# Altium project COMPSYS301_Group2.PrjPcb
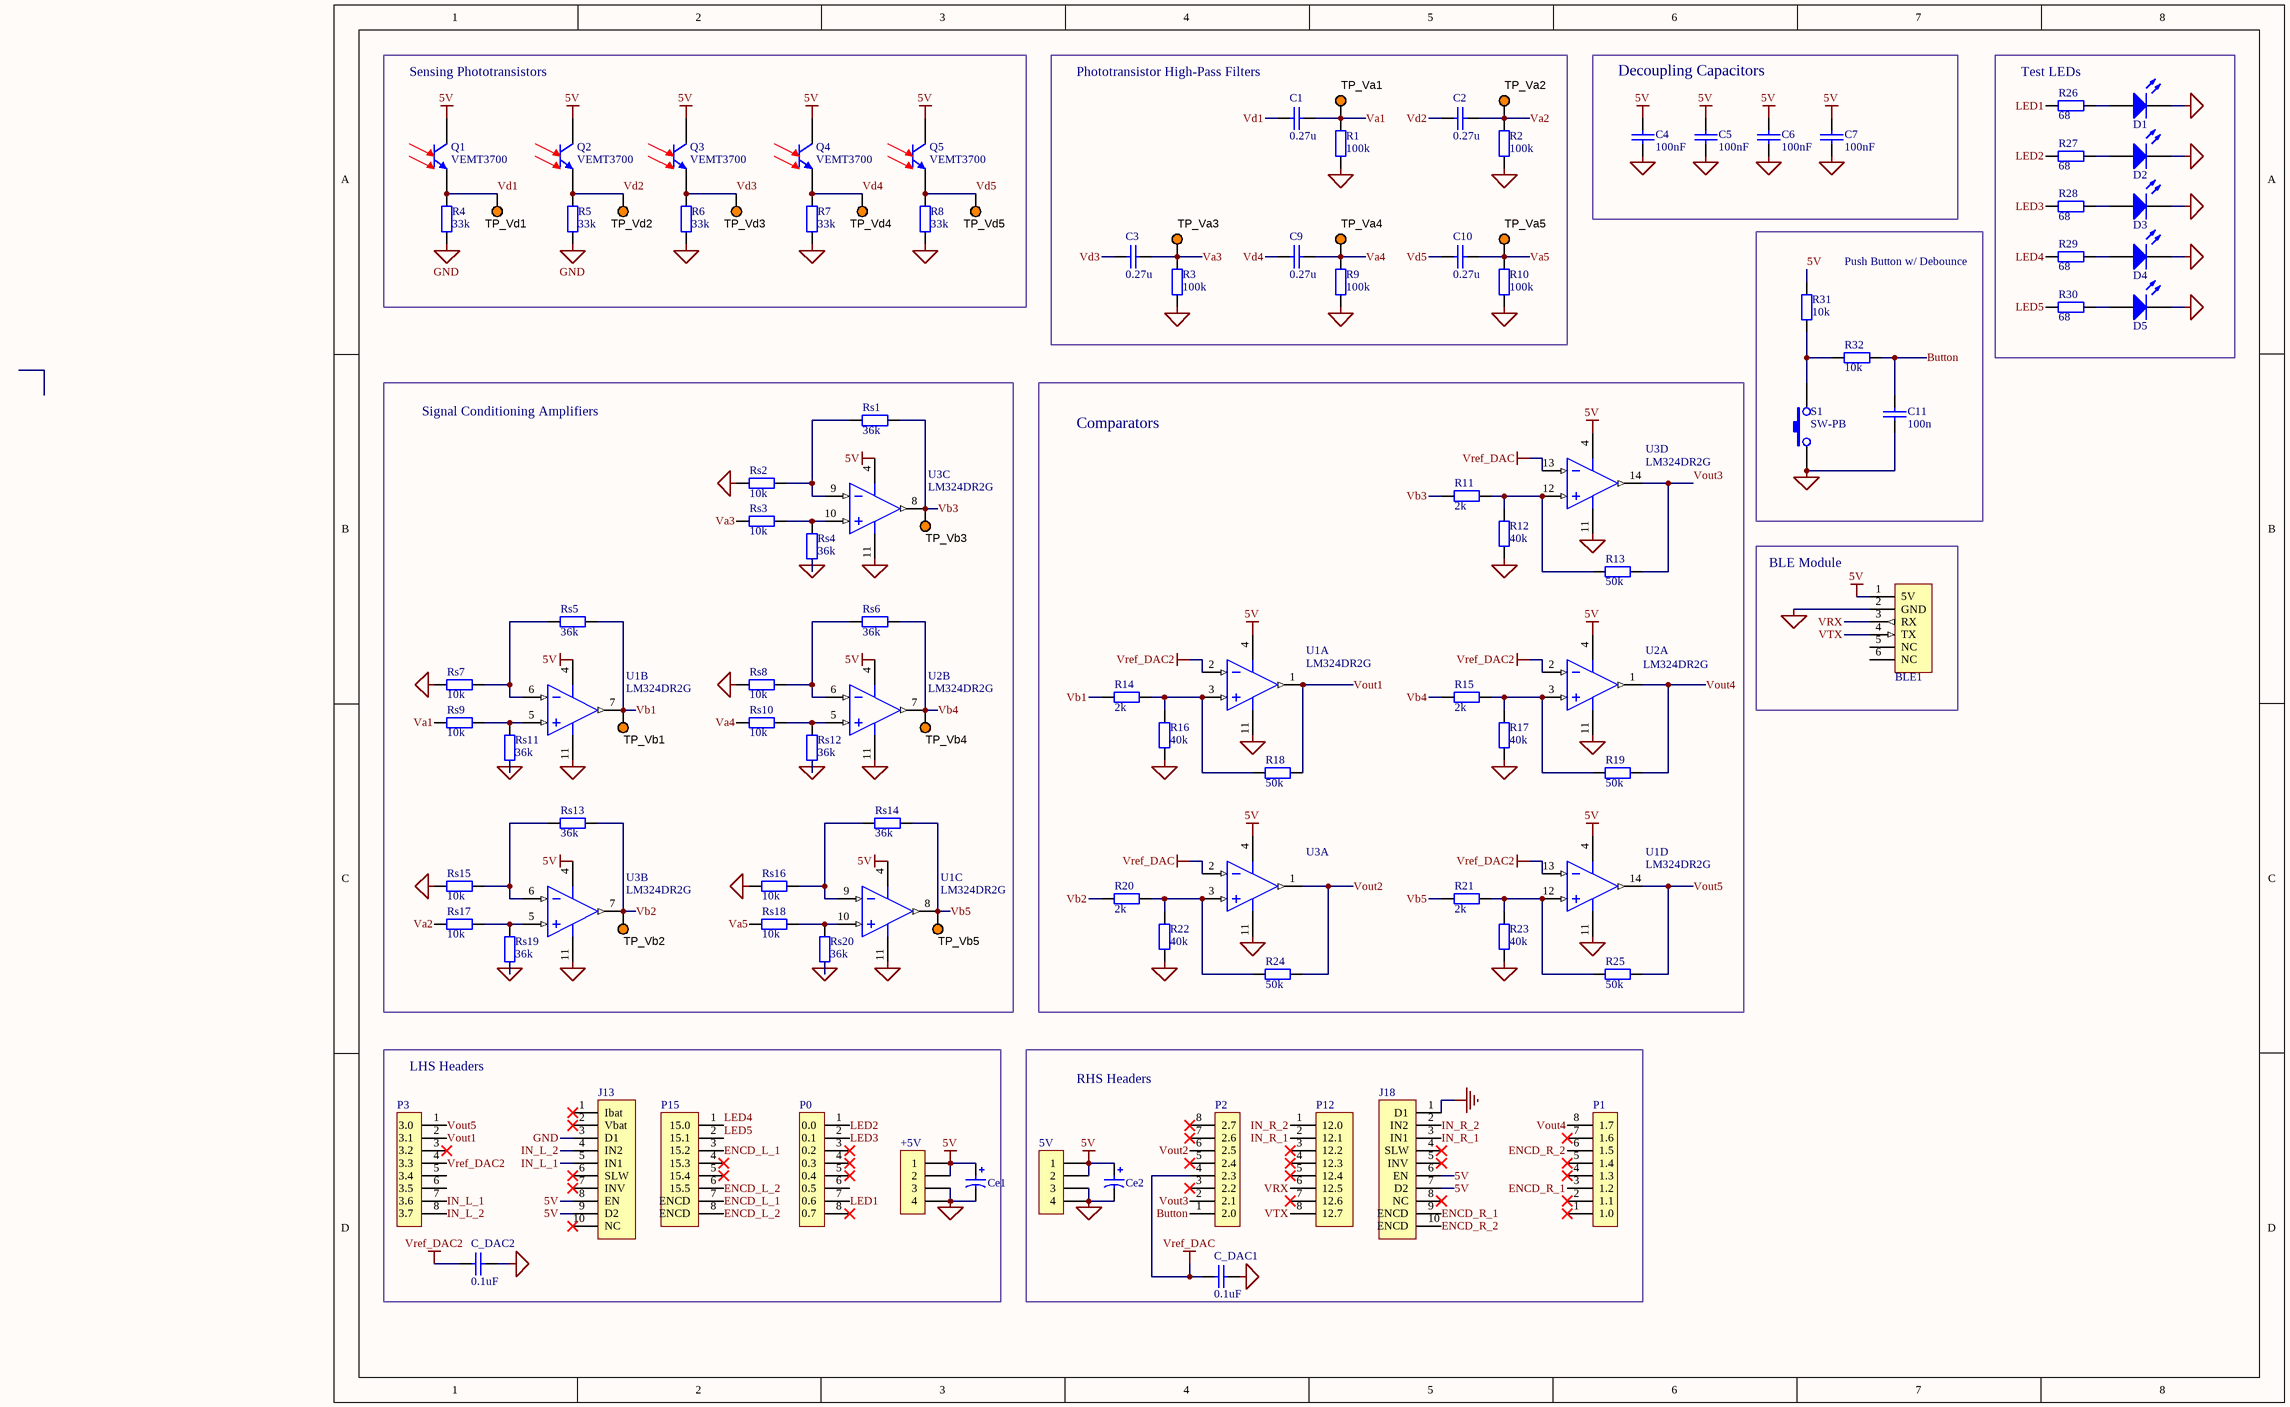
[diagram p0: Group2_Sensing.SchDoc]
1 sheet, 106 parts. Net scope: global (net labels, ports and power ports of the same name join across sheets).
Board file: Group2_PCB.PcbDoc

## Sheet Group2_Sensing.SchDoc
size A3; SheetNumber: 1; SheetTotal: 1

### Parts
5V  5V  [IDC4]  (value not drawn)
+5V  5V  [IDC4]  (value not drawn)
BLE1  BLE Module Header  [HM10_HDR1X6]  (value not drawn)
C1  0.27u  [0805 CAP]
C2  0.27u  [0805 CAP]
C3  0.27u  [0805 CAP]
C4  100nF  [0805 CAP]
C5  100nF  [0805 CAP]
C6  100nF  [0805 CAP]
C7  100nF  [0805 CAP]
C9  0.27u  [0805 CAP]
C10  0.27u  [0805 CAP]
C11  100n  [0805 CAP]
C_DAC1  0.1uF  [0805 CAP]
C_DAC2  0.1uF  [0805 CAP]
Ce1  100uF  [CAP POL 8x5.4mm SMT]  (value not drawn)
Ce2  100uF  [CAP POL 8x5.4mm SMT]  (value not drawn)
D1  LTST-C170KGKT  [0805 LED]  (value not drawn)
D2  LTST-C170KGKT  [0805 LED]  (value not drawn)
D3  LTST-C170KGKT  [0805 LED]  (value not drawn)
D4  LTST-C170KGKT  [0805 LED]  (value not drawn)
D5  LTST-C170KGKT  [0805 LED]  (value not drawn)
J13  CON10  [idc10]  (value not drawn)
J18  CON10  [IDC10]  (value not drawn)
P0  P0  [idc8]  (value not drawn)
P1  P1  [idc8]  (value not drawn)
P2  P2  [idc8]  (value not drawn)
P3  P3  [idc8]  (value not drawn)
P12  P12  [idc8]  (value not drawn)
P15  P15  [idc8]  (value not drawn)
Q1  VEMT3700  [VEMT3700]
Q2  VEMT3700  [VEMT3700]
Q3  VEMT3700  [VEMT3700]
Q4  VEMT3700  [VEMT3700]
Q5  VEMT3700  [VEMT3700]
R1  100k  [0805 RES]
R2  100k  [0805 RES]
R3  100k  [0805 RES]
R4  33k  [0805 RES]
R5  33k  [0805 RES]
R6  33k  [0805 RES]
R7  33k  [0805 RES]
R8  33k  [0805 RES]
R9  100k  [0805 RES]
R10  100k  [0805 RES]
R11  2k  [0805 RES]
R12  40k  [0805 RES]
R13  50k  [0805 RES]
R14  2k  [0805 RES]
R15  2k  [0805 RES]
R16  40k  [0805 RES]
R17  40k  [0805 RES]
R18  50k  [0805 RES]
R19  50k  [0805 RES]
R20  2k  [0805 RES]
R21  2k  [0805 RES]
R22  40k  [0805 RES]
R23  40k  [0805 RES]
R24  50k  [0805 RES]
R25  50k  [0805 RES]
R26  68  [0805 RES]
R27  68  [0805 RES]
R28  68  [0805 RES]
R29  68  [0805 RES]
R30  68  [0805 RES]
R31  10k  [0805 RES]
R32  10k  [0805 RES]
Rs1  36k  [0805 RES]
Rs2  10k  [0805 RES]
Rs3  10k  [0805 RES]
Rs4  36k  [0805 RES]
Rs5  36k  [0805 RES]
Rs6  36k  [0805 RES]
Rs7  10k  [0805 RES]
Rs8  10k  [0805 RES]
Rs9  10k  [0805 RES]
Rs10  10k  [0805 RES]
Rs11  36k  [0805 RES]
Rs12  36k  [0805 RES]
Rs13  36k  [0805 RES]
Rs14  36k  [0805 RES]
Rs15  10k  [0805 RES]
Rs16  10k  [0805 RES]
Rs17  10k  [0805 RES]
Rs18  10k  [0805 RES]
Rs19  36k  [0805 RES]
Rs20  36k  [0805 RES]
S1  SW-PB  [SW-PB]
TP_Va1  5003  [TP_TH]  (value not drawn)
TP_Va2  5003  [TP_TH]  (value not drawn)
TP_Va3  5003  [TP_TH]  (value not drawn)
TP_Va4  5003  [TP_TH]  (value not drawn)
TP_Va5  5003  [TP_TH]  (value not drawn)
TP_Vb1  5003  [TP_TH]  (value not drawn)
TP_Vb2  5003  [TP_TH]  (value not drawn)
TP_Vb3  5003  [TP_TH]  (value not drawn)
TP_Vb4  5003  [TP_TH]  (value not drawn)
TP_Vb5  5003  [TP_TH]  (value not drawn)
TP_Vd1  5003  [TP_TH]  (value not drawn)
TP_Vd2  5003  [TP_TH]  (value not drawn)
TP_Vd3  5003  [TP_TH]  (value not drawn)
TP_Vd4  5003  [TP_TH]  (value not drawn)
TP_Vd5  5003  [TP_TH]  (value not drawn)
U1  LM324DR2G  [SOIC-14]  (parts A,B,C,D of 4)
U2  LM324DR2G  [SOIC-14]  (parts A,B of 4)
U3  (no value)  [SOIC-14]  (parts A,B,C,D of 4)

### Blocks framed on the sheet
Sensing Phototransistors: Q1-Q5 R4-R8 TP_Vd1-TP_Vd5
Phototransistor High-Pass Filters: C1-C3 C9 C10 R1-R3 R9 R10 TP_Va1-TP_Va5
Decoupling Capacitors: C4-C7
Test LEDs: D1-D5 R26-R30
Push Button w/ Debounce: C11 R31 R32 S1
Signal Conditioning Amplifiers: Rs1-Rs20 TP_Vb1-TP_Vb5 U1-U3
Comparators: R11-R25 U1-U3
BLE Module: BLE1
LHS Headers: +5V C_DAC2 Ce1 J13 P0 P3 P15
RHS Headers: 5V C_DAC1 Ce2 J18 P1 P2 P12

### Nets
5V: 5V.1 5V.2 +5V.1 +5V.2 BLE1.1(5V) C4.1 C5.1 C6.1 C7.1 Ce1.1 Ce2.1 J13.8(EN) J13.9(D2) J18.6(EN) J18.7(D2) Q1.1(C) Q2.1(C) Q3.1(C) Q4.1(C) Q5.1(C) R31.1 U1.4(VCC) U2.4(VCC) U3.4(VCC)
GND: 5V.3 5V.4 +5V.3 +5V.4 BLE1.2(GND) C4.2 C5.2 C6.2 C7.2 C11.2 C_DAC1.2 C_DAC2.2 Ce1.2 Ce2.2 D1.2(K) D2.2(K) D3.2(K) D4.2(K) D5.2(K) J13.3(D1) J18.1(D1) R1.1 R2.1 R3.1 R4.1 R5.1 R6.1 R7.1 R8.1 R9.1 R10.1 R12.2 R16.2 R17.2 R22.2 R23.2 Rs2.1 Rs4.1 Rs7.1 Rs8.1 Rs11.1 Rs12.1 Rs15.1 Rs16.1 Rs19.1 Rs20.1 S1.1 U1.11(VEE/GND) U2.11(VEE/GND) U3.11(VEE/GND)
Vref_DAC: C_DAC1.1 P2.4(2.3) U3.2(IN1-) U3.13(IN4-)
Vref_DAC2: C_DAC2.1 P3.4(3.3) U1.2(IN1-) U1.13(IN4-) U2.2(IN1-)
Button: C11.1 P2.1(2.0) R32.1
ENCD_L_1: P15.3(15.2) P15.7(ENCD)
ENCD_L_2: P15.6(15.5) P15.8(ENCD)
ENCD_R_1: J18.9(ENCD) P1.3(1.2)
ENCD_R_2: J18.10(ENCD) P1.6(1.5)
IN_L_1: J13.5(IN1) P3.7(3.6)
IN_L_2: J13.4(IN2) P3.8(3.7)
IN_R_1: J18.3(IN1) P12.2(12.1)
IN_R_2: J18.2(IN2) P12.1(12.0)
LED1: P0.7(0.6) R26.1
LED2: P0.1(0.0) R27.1
LED3: P0.2(0.1) R28.1
LED4: P15.1(15.0) R29.1
LED5: P15.2(15.1) R30.1
Va1: C1.2 R1.2 Rs9.1 TP_Va1.1
Va2: C2.2 R2.2 Rs17.1 TP_Va2.1
Va3: C3.2 R3.2 Rs3.1 TP_Va3.1
Va4: C9.2 R9.2 Rs10.1 TP_Va4.1
Va5: C10.2 R10.2 Rs18.1 TP_Va5.1
Vb1: R14.1 Rs5.2 TP_Vb1.1 U1.7(OUT2)
Vb2: R20.1 Rs13.2 TP_Vb2.1 U3.7(OUT2)
Vb3: R11.1 Rs1.2 TP_Vb3.1 U3.8(OUT3)
Vb4: R15.1 Rs6.2 TP_Vb4.1 U2.7(OUT2)
Vb5: R21.1 Rs14.2 TP_Vb5.1 U1.8(OUT3)
Vd1: C1.1 Q1.2(E) R4.2 TP_Vd1.1
Vd2: C2.1 Q2.2(E) R5.2 TP_Vd2.1
Vd3: C3.1 Q3.2(E) R6.2 TP_Vd3.1
Vd4: C9.1 Q4.2(E) R7.2 TP_Vd4.1
Vd5: C10.1 Q5.2(E) R8.2 TP_Vd5.1
Vout1: P3.2(3.1) R18.1 U1.1(OUT1)
Vout2: P2.6(2.5) R24.1 U3.1(OUT1)
Vout3: P2.2(2.1) R13.1 U3.14(OUT4)
Vout4: P1.8(1.7) R19.1 U2.1(OUT1)
Vout5: P3.1(3.0) R25.1 U1.14(OUT4)
VRX: BLE1.3(RX) P12.6(12.5)
VTX: BLE1.4(TX) P12.8(12.7)
NetD1_1: D1.1(A) R26.2
NetD2_1: D2.1(A) R27.2
NetD3_1: D3.1(A) R28.2
NetD4_1: D4.1(A) R29.2
NetD5_1: D5.1(A) R30.2
NetR11_2: R11.2 R12.1 R13.2 U3.12(IN4+)
NetR14_2: R14.2 R16.1 R18.2 U1.3(IN1+)
NetR15_2: R15.2 R17.1 R19.2 U2.3(IN1+)
NetR20_2: R20.2 R22.1 R24.2 U3.3(IN1+)
NetR21_2: R21.2 R23.1 R25.2 U1.12(IN4+)
NetR31_2: R31.2 R32.2 S1.2
NetRs1_1: Rs1.1 Rs2.2 U3.9(IN3-)
NetRs3_2: Rs3.2 Rs4.2 U3.10(IN3+)
NetRs5_1: Rs5.1 Rs7.2 U1.6(IN2-)
NetRs6_1: Rs6.1 Rs8.2 U2.6(IN2-)
NetRs9_2: Rs9.2 Rs11.2 U1.5(IN2+)
NetRs10_2: Rs10.2 Rs12.2 U2.5(IN2+)
NetRs13_1: Rs13.1 Rs15.2 U3.6(IN2-)
NetRs14_1: Rs14.1 Rs16.2 U1.9(IN3-)
NetRs17_2: Rs17.2 Rs19.2 U3.5(IN2+)
NetRs18_2: Rs18.2 Rs20.2 U1.10(IN3+)

Not connected (* = marked no-connect by the designer): BLE1 5(NC) 6(NC); J13 1(Ibat)* 2(Vbat)* 6(SLW)* 7(INV)* 10(NC)*; J18 4(SLW)* 5(INV)* 8(NC)*; P0 3(0.2)* 4(0.3)* 5(0.4)* 6(0.5) 8(0.7)*; P1 1(1.0)* 2(1.1)* 4(1.3)* 5(1.4)* 7(1.6)*; P2 3(2.2)* 5(2.4)* 7(2.6)* 8(2.7)*; P3 3(3.2)* 5(3.4) 6(3.5); P12 3(12.2)* 4(12.3)* 5(12.4)* 7(12.6)*; P15 4(15.3)* 5(15.4)*

### Library data of the parts
5V +5V = CON4: Connector
BLE1 = BLEModule_TH: 2.54mm pitch 6-pin header for BLE module; LatestRevisionDate: 17-Jul-2002; LatestRevisionNote: Re-released for DXP Platform.; Publisher: Altium Limited
C1-C7 C9-C11 C_DAC1 C_DAC2 = CerCap_SMT_0805: SMT ceramic capacitor 0805 size; Value: *
Ce1 Ce2 = ElecCap_SMT_8D0: CAP ALUM 22UF 20% 50V SMD (Model: UWX1H220MCL1GB); Manufacturer: Nichicon; Manufacturer Part Number: UWX1V220MCL1GB; Lifetime @ Temp.: 2000 Hrs @ 85°C; Polarization: Polar; Surface Mount Land Size: 0.260" L x 0.260" W (6.60mm x 6.60mm); Capacitance 1: 22 µF; Revision: July-2002: Re-released for DXP Platform.; RoHS: RoHS Compliant; Category: Capacitors; Stock 1: 680; Pricing 1: 1=0.59, 10=0.406, 100=0.2304, 500=0.16268 (NZD); Packaging: Cut Tape (CT); Part Status: Active; Tolerance: ±20%; ESR (Equivalent Series Resistance): -; Operating Temperature: -40°C ~ 85°C; Ratings: -; Applications: General Purpose; Lead Spacing: -; Size / Dimension: 0.248" Dia (6.30mm); Height - Seated (Max): 0.213" (5.40mm); Mounting Type: Surface Mount; Package / Case: Radial, Can - SMD; ComponentLink1URL: http://nichicon-us.com/english/products/pdfs/e-uwx.pdf; ComponentLink1Description: http://nichicon-us.com/english/products/pdfs/e-uwx.pdf; Supplier 1: Digi-Key; Supplier Part Number 1: 493-2136-1-ND; Value: *
D1-D5 = LED_SMT_0805: SMT LED 0805 size; Manufacturer: Lite-On Inc.; Color: Green; Lens Color: Colorless; Lens Transparency: Clear; Millicandela Rating: 35mcd; Lens Style/Size: Rectangle with Flat Top, 1.40mm x 1.25mm; Voltage - Forward (Vf) (Typ): 2V; Current - Test: 20mA; Viewing Angle: 130°; Wavelength - Dominant: 571nm; Wavelength - Peak: 574nm; Supplier 1: Digi-Key; Manufacturer Part Number: LTST-C170KGKT; RoHS: RoHS Compliant; Category: Optoelectronics; Stock 1: 503069; Pricing 1: 1=0.62, 10=0.459, 25=0.338, 100=0.2415, 250=0.16416, 500=0.14486, 1000=0.11347 (NZD); Packaging: Cut Tape (CT); Part Status: Active; Mounting Type: Surface Mount; Features: -; Package / Case: 0805 (2012 Metric); Size / Dimension: 2.00mm L x 1.25mm W; Height (Max): 1.10mm; ComponentLink1URL: http://optoelectronics.liteon.com/upload/download/DS22-2000-073/LTST-C170KGKT.pdf; ComponentLink1Description: http://optoelectronics.liteon.com/upload/download/DS22-2000-073/LTST-C170KGKT.pdf; Supplier Part Number 1: 160-1414-1-ND
J13 J18 = CON10: Connector
P0-P3 = CON8: Connector
P12 P15 = CON8_1: Connector
Q1-Q5 = VEMT3700: Silicon NPN Phototransistor
R1-R32 Rs1-Rs20 = Res_SMT_0805: 0805 resistor; Published: 8-Jun-2000; LatestRevisionDate: 17-Jul-2002; LatestRevisionNote: Re-released for DXP Platform.; PackageReference: AXIAL-0.4; Publisher: Altium Limited; Value: *; ComponentLink1Description: https://nz.mouser.com/datasheet/2/315/AOA0000C304-1149620.pdf
S1 = SW-PB: Push Button Switch
TP_Va1-TP_Va5 TP_Vb1-TP_Vb5 TP_Vd1-TP_Vd5 = TestPoint: Test Point, Orange, 1-Pin THD, RoHS; Peak Reverse Current: 600 uA; Forward Current: 3 A; Max Surge Current: 80 A; Forward Voltage: 1.08 V; Max Operating Temperature: 150 degC; PackageReference: 5003; Pins: 2; ComponentLink2URL: http://keyelco.com/userAssets/file/M65p56.pdf; PackageDescription: 1-Pin Through Hole Device, Dia 2.54 mm; Weight: 0.01 lb; Diameter: 5.3 mm; Mount: Through Hole; Package Quantity: 500; Packaging: Bulk; Min Operating Temperature: -65 degC; ComponentLink1Description: Manufacturer URL; Height: 0.25 inch; ComponentLink1URL: http://www.keyelco.com/; ComponentLink2Description: Datasheet; Width: 0.25 inch; REACH SVHC: No SVHC; RoHSCompliant: true; Radiation Hardening: No; Length: 9.5 mm; DatasheetVersion: Jun-15
U1 U2 = LM324DR_SMT_SOIC16: Single Supply Quad Operational Amplifier, 3 to 32 V, 0 to 70 degC, 14-Pin SOIC, Pb-Free, Tape and Reel; Manufacturer: On Semiconductor; VCC Max (V): 32; VCC Min (V): 3; ComponentLink1URL: http://www.onsemi.com/; ComponentLink1Description: Manufacturer URL; PackageVersion: Rev. K, 05/2011; ComponentLink3URL: http://www.onsemi.com/pub_link/Collateral/751A-03.PDF; ComponentLink3Description: Package Specification; Packing: Tape and Reel; ComponentLink2URL: http://www.onsemi.cn/pub_link/Collateral/LM324-D.PDF; PackageReference: SOIC-14-751A-03; PackageDescription: 14-Pin Small Outline Integrated Circuit, Body 8.65 x 3.9 mm, Pitch 1.27 mm; DatasheetVersion: Rev. 25; Mounting Technology: Surface Mount; RoHS: TRUE; ComponentLink2Description: Datasheet; PartNumber: LM324DR2G
U3 = LM324DR_SMT_SOIC16: Single Supply Quad Operational Amplifier, 3 to 32 V, 0 to 70 degC, 14-Pin SOIC, Pb-Free, Tape and Reel; Manufacturer: On Semiconductor; PartNumber: LM324DR2G; VCC Max (V): 32; VCC Min (V): 3; PackageVersion: Rev. K, 05/2011; ComponentLink3URL: http://www.onsemi.com/pub_link/Collateral/751A-03.PDF; ComponentLink3Description: Package Specification; Packing: Tape and Reel; ComponentLink2URL: http://www.onsemi.cn/pub_link/Collateral/LM324-D.PDF; PackageReference: SOIC-14-751A-03; ComponentLink1URL: http://www.onsemi.com/; PackageDescription: 14-Pin Small Outline Integrated Circuit, Body 8.65 x 3.9 mm, Pitch 1.27 mm; ComponentLink1Description: Manufacturer URL; DatasheetVersion: Rev. 25; Mounting Technology: Surface Mount; RoHS: TRUE; ComponentLink2Description: Datasheet